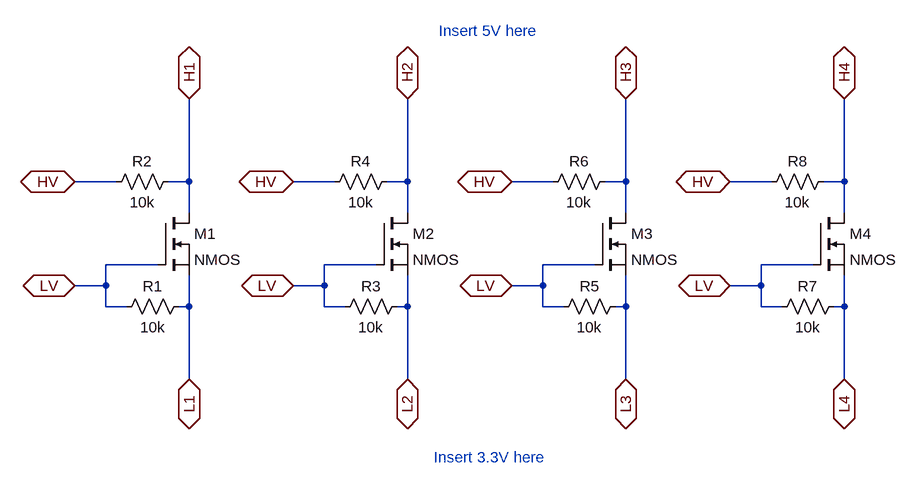
[diagram p0: schematic WWZMDiB_Level_Shifter.asc]
WWZMDiB_Level_Shifter.asc, the LTspice schematic file:
Version 4.1
SHEET 1 1332 680
WIRE 128 80 64 80
WIRE 240 80 240 -48
WIRE 240 80 208 80
WIRE 464 80 400 80
WIRE 576 80 576 -48
WIRE 576 80 544 80
WIRE 800 80 736 80
WIRE 912 80 912 -48
WIRE 912 80 880 80
WIRE 1136 80 1072 80
WIRE 1248 80 1248 -48
WIRE 1248 80 1216 80
WIRE 240 128 240 80
WIRE 576 128 576 80
WIRE 912 128 912 80
WIRE 1248 128 1248 80
WIRE 192 208 112 208
WIRE 528 208 448 208
WIRE 864 208 784 208
WIRE 1200 208 1120 208
WIRE 112 240 112 208
WIRE 112 240 64 240
WIRE 448 240 448 208
WIRE 448 240 400 240
WIRE 784 240 784 208
WIRE 784 240 736 240
WIRE 1120 240 1120 208
WIRE 1120 240 1072 240
WIRE 112 272 112 240
WIRE 144 272 112 272
WIRE 240 272 240 224
WIRE 240 272 224 272
WIRE 448 272 448 240
WIRE 480 272 448 272
WIRE 576 272 576 224
WIRE 576 272 560 272
WIRE 784 272 784 240
WIRE 816 272 784 272
WIRE 912 272 912 224
WIRE 912 272 896 272
WIRE 1120 272 1120 240
WIRE 1152 272 1120 272
WIRE 1248 272 1248 224
WIRE 1248 272 1232 272
WIRE 240 384 240 272
WIRE 576 384 576 272
WIRE 912 384 912 272
WIRE 1248 384 1248 272
FLAG 64 240 LV
IOPIN 64 240 BiDir
FLAG 64 80 HV
IOPIN 64 80 BiDir
FLAG 240 384 L1
IOPIN 240 384 BiDir
FLAG 240 -48 H1
IOPIN 240 -48 BiDir
FLAG 400 240 LV
IOPIN 400 240 BiDir
FLAG 400 80 HV
IOPIN 400 80 BiDir
FLAG 576 384 L2
IOPIN 576 384 BiDir
FLAG 576 -48 H2
IOPIN 576 -48 BiDir
FLAG 736 240 LV
IOPIN 736 240 BiDir
FLAG 736 80 HV
IOPIN 736 80 BiDir
FLAG 912 384 L3
IOPIN 912 384 BiDir
FLAG 912 -48 H3
IOPIN 912 -48 BiDir
FLAG 1072 240 LV
IOPIN 1072 240 BiDir
FLAG 1072 80 HV
IOPIN 1072 80 BiDir
FLAG 1248 384 L4
IOPIN 1248 384 BiDir
FLAG 1248 -48 H4
IOPIN 1248 -48 BiDir
SYMBOL nmos 192 128 R0
SYMATTR InstName M1
SYMBOL res 240 256 R90
WINDOW 0 0 56 VBottom 2
WINDOW 3 32 56 VTop 2
SYMATTR InstName R1
SYMATTR Value 10k
SYMBOL res 224 64 R90
WINDOW 0 0 56 VBottom 2
WINDOW 3 32 56 VTop 2
SYMATTR InstName R2
SYMATTR Value 10k
SYMBOL nmos 528 128 R0
SYMATTR InstName M2
SYMBOL res 576 256 R90
WINDOW 0 0 56 VBottom 2
WINDOW 3 32 56 VTop 2
SYMATTR InstName R3
SYMATTR Value 10k
SYMBOL res 560 64 R90
WINDOW 0 0 56 VBottom 2
WINDOW 3 32 56 VTop 2
SYMATTR InstName R4
SYMATTR Value 10k
SYMBOL nmos 864 128 R0
SYMATTR InstName M3
SYMBOL res 912 256 R90
WINDOW 0 0 56 VBottom 2
WINDOW 3 32 56 VTop 2
SYMATTR InstName R5
SYMATTR Value 10k
SYMBOL res 896 64 R90
WINDOW 0 0 56 VBottom 2
WINDOW 3 32 56 VTop 2
SYMATTR InstName R6
SYMATTR Value 10k
SYMBOL nmos 1200 128 R0
SYMATTR InstName M4
SYMBOL res 1248 256 R90
WINDOW 0 0 56 VBottom 2
WINDOW 3 32 56 VTop 2
SYMATTR InstName R7
SYMATTR Value 10k
SYMBOL res 1232 64 R90
WINDOW 0 0 56 VBottom 2
WINDOW 3 32 56 VTop 2
SYMATTR InstName R8
SYMATTR Value 10k
TEXT 616 504 Left 2 ;Insert 3.3V here
TEXT 624 -152 Left 2 ;Insert 5V here

The netlist it stands for:
* WWZMDiB_Level_Shifter.asc
M1 H1 LV L1 L1 NMOS
R1 L1 LV 10k
R2 H1 HV 10k
M2 H2 LV L2 L2 NMOS
R3 L2 LV 10k
R4 H2 HV 10k
M3 H3 LV L3 L3 NMOS
R5 L3 LV 10k
R6 H3 HV 10k
M4 H4 LV L4 L4 NMOS
R7 L4 LV 10k
R8 H4 HV 10k
.model NMOS NMOS
.model PMOS PMOS
.lib standard.mos
* Insert 3.3V here
* Insert 5V here
.backanno
.end